# Altium schematic sheet Sheet2.SchDoc
size A4; SheetNumber: 1; SheetTotal: 1
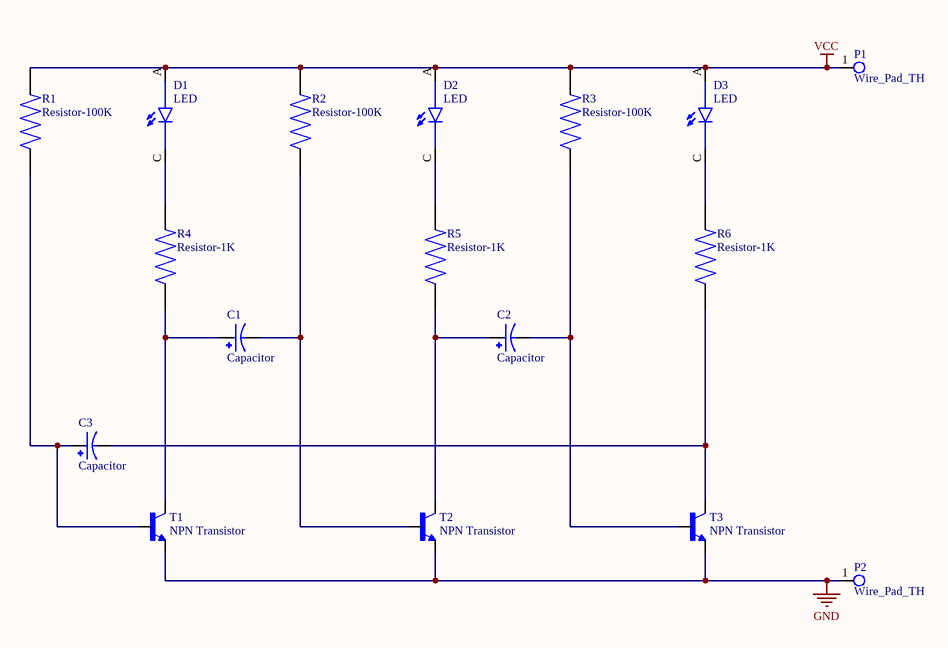
[diagram p0: Sheet2.SchDoc]

## Parts
C1  Capacitor  [CAPACITOR]
C2  Capacitor  [CAPACITOR]
C3  Capacitor  [CAPACITOR]
D1  LED  [LED]
D2  LED  [LED]
D3  LED  [LED]
P1  Wire_Pad_TH  [Wire_Pad_TH]
P2  Wire_Pad_TH  [Wire_Pad_TH]
R1  Resistor-100K  [Resistor]
R2  Resistor-100K  [Resistor]
R3  Resistor-100K  [Resistor]
R4  Resistor-1K  [Resistor]
R5  Resistor-1K  [Resistor]
R6  Resistor-1K  [Resistor]
T1  NPN Transistor  [TRANSISTOR]
T2  NPN Transistor  [TRANSISTOR]
T3  NPN Transistor  [TRANSISTOR]

## Nets
GND: P2.1 T1.1(E) T2.1(E) T3.1(E)
VCC: D1.A D2.A D3.A P1.1 R1.2 R2.2 R3.2
NetC1_N: C1.N R2.1 T2.2(B)
NetC1_P: C1.P R4.1 T1.3(C)
NetC2_N: C2.N R3.1 T3.2(B)
NetC2_P: C2.P R5.1 T2.3(C)
NetC3_N: C3.N R6.1 T3.3(C)
NetC3_P: C3.P R1.1 T1.2(B)
NetD1_C: D1.C R4.2
NetD2_C: D2.C R5.2
NetD3_C: D3.C R6.2

## Library data of the parts
C1-C3 = Capacitor: CAP ALUM 10UF 20% 450V RADIAL; MP: ECA-2WM100B; MF: Panasonic; Availability: In Stock; Check_prices: https://www.snapeda.com/parts/ECA-2WM100B/Panasonic/view-part/2313535/?ref=eda; SnapEDA_Link: https://www.snapeda.com/parts/ECA-2WM100B/Panasonic/view-part/2313535/?ref=snap; Value: *; Price: None; Purchase-URL: https://pricing.snapeda.com/search/part/ECA-2WM100B/?ref=eda; Package: RADIAL-2 Panasonic
D1-D3 = LED: Red 617nm LED Indication - Discrete 2V Radial; MP: WP7113ID; MF: Kingbright; Price: None; Package: Radial Kingbright; Check_prices: https://www.snapeda.com/parts/WP7113ID/Kingbright/view-part/?ref=eda; Purchase-URL: https://pricing.snapeda.com/search/part/WP7113ID/?ref=eda; Availability: In Stock; Value: *; SnapEDA_Link: https://www.snapeda.com/parts/WP7113ID/Kingbright/view-part/?ref=snap
R1-R3 = Resistor-1K: 100 kOhms Â±1% 0.25W, 1/4W Through Hole Resistor Axial - Metal Film; MF: Yageo; MP: MFR-25FBF52-1K; SnapEDA_Link: https://www.snapeda.com/parts/MFR-25FBF52-1K/Yageo/view-part/?ref=snap; Package: RADIAL-2 YAGEO; Value: *; Check_prices: https://www.snapeda.com/parts/MFR-25FBF52-1K/Yageo/view-part/?ref=eda
R4-R6 = Resistor-1K: 1.07 kOhms Â±1% 0.25W, 1/4W Through Hole Resistor Axial - Metal Film; MF: Yageo; MP: MFR-25FBF52-1K; SnapEDA_Link: https://www.snapeda.com/parts/MFR-25FBF52-1K/Yageo/view-part/?ref=snap; Package: RADIAL-2 YAGEO; Value: *; Check_prices: https://www.snapeda.com/parts/MFR-25FBF52-1K/Yageo/view-part/?ref=eda
T1-T3 = NPN Transistor: BJT, TO-92, 40V, 600mA, NPN, 0.625W, 150Â°C; MF: Diotec Semiconductor; MP: 2N2222A; SnapEDA_Link: https://www.snapeda.com/parts/2N2222A/Diotec/view-part/?ref=snap; Package: TO-92 Diotec; Value: *; Check_prices: https://www.snapeda.com/parts/2N2222A/Diotec/view-part/?ref=eda